# Altium schematic sheet 04_SoC_CFG_GPIOs.SchDoc
size A3; SheetNumber: 21; SheetTotal: 21
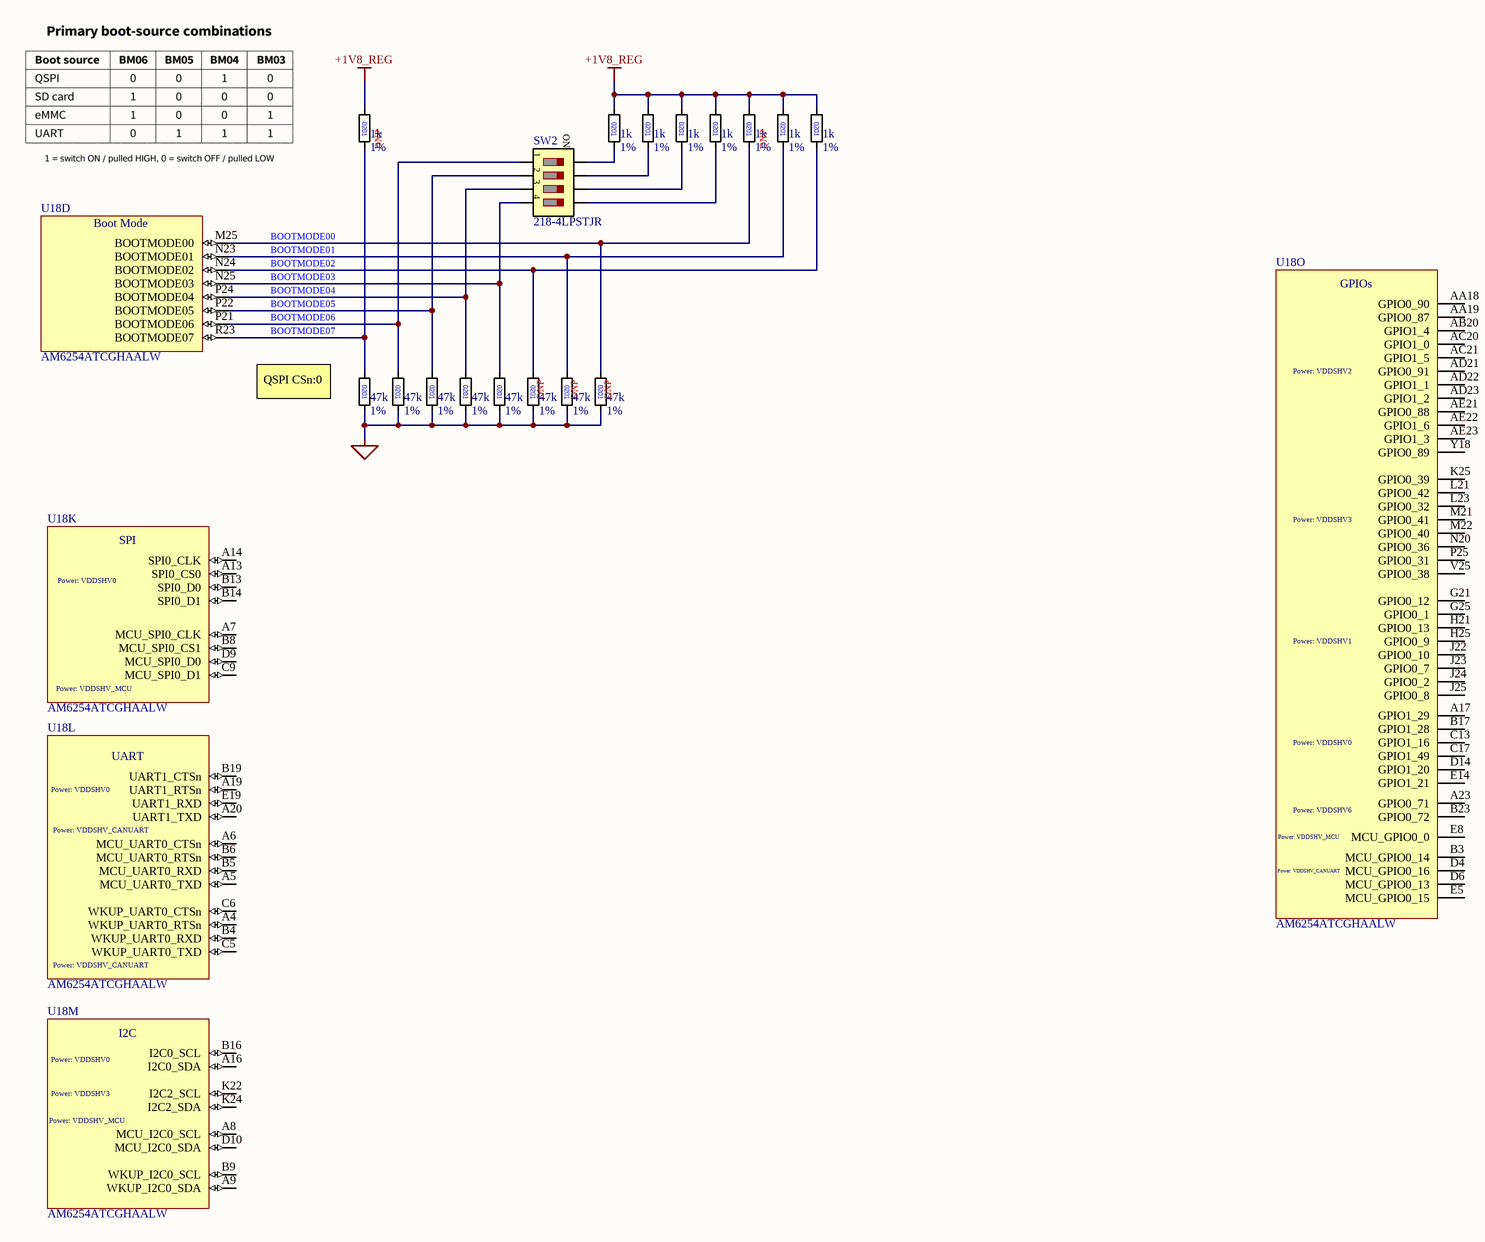
[diagram p0: 04_SoC_CFG_GPIOs.SchDoc]

## Parts
(Parts that share a designator on the sheet are numbered #1, #2 ... from top to bottom, then left to right.)
R196  value 1k  Tolerance: 1%  [R0201]  (hidden comment: 0201)
R197  value 1k  Tolerance: 1%  [R0201]  (hidden comment: 0201)
R198  value 1k  Tolerance: 1%  [R0201]  (hidden comment: 0201)
R199  value 1k  Tolerance: 1%  [R0201]  (hidden comment: 0201)
R200  value 1k  Tolerance: 1%  [R0201]  (hidden comment: 0201)
R201  value 1k  Tolerance: 1%  [R0201]  (hidden comment: 0201)
R202  value 1k  Tolerance: 1%  [R0201]  (hidden comment: 0201)
R203  value 1k  Tolerance: 1%  [R0201]  (hidden comment: 0201)
R204  value 47k  Tolerance: 1%  [R0201]  (hidden comment: 0201)
R205  value 47k  Tolerance: 1%  [R0201]  (hidden comment: 0201)
R206  value 47k  Tolerance: 1%  [R0201]  (hidden comment: 0201)
R207  value 47k  Tolerance: 1%  [R0201]  (hidden comment: 0201)
R208  value 47k  Tolerance: 1%  [R0201]  (hidden comment: 0201)
R209  value 47k  Tolerance: 1%  [R0201]  (hidden comment: 0201)
R210  value 47k  Tolerance: 1%  [R0201]  (hidden comment: 0201)
R211  value 47k  Tolerance: 1%  [R0201]  (hidden comment: 0201)
SW2  218-4LPSTJR  [SW_DIP_SPSTx04_Slide]
U18#1  AM6254ATCGHAALW  [AM6254ATCGHAALW]  (parts D,K,M,O of 15)
U18#2  AM6254ATCGHAALW  [AM6254ATCGHAALW]  (part L of 14)

## Nets
+1V8_REG: R196.1 R197.1 R198.1 R199.1 R200.1 R201.1 R202.1 R203.1
GND: R204.2 R205.2 R206.2 R207.2 R208.2 R209.2 R210.2 R211.2
BOOTMODE00: R201.2 R211.1 U18#1.M25(BOOTMODE00)
BOOTMODE01: R202.2 R210.1 U18#1.N23(BOOTMODE01)
BOOTMODE02: R203.2 R209.1 U18#1.N24(BOOTMODE02)
BOOTMODE03: R208.1 SW2.4 U18#1.N25(BOOTMODE03)
BOOTMODE04: R207.1 SW2.3 U18#1.P24(BOOTMODE04)
BOOTMODE05: R206.1 SW2.2 U18#1.P22(BOOTMODE05)
BOOTMODE06: R205.1 SW2.1 U18#1.P21(BOOTMODE06)
BOOTMODE07: R196.2 R204.1 U18#1.R23(BOOTMODE07)
NetR197_2: R197.2 SW2.8
NetR198_2: R198.2 SW2.7
NetR199_2: R199.2 SW2.6
NetR200_2: R200.2 SW2.5

Not connected (* = marked no-connect by the designer): U18#1 A7(MCU_SPI0_CLK) A8(MCU_I2C0_SCL) A9(WKUP_I2C0_SDA) A13(SPI0_CS0) A14(SPI0_CLK) A16(I2C0_SDA) A17(GPIO1_29) A23(GPIO0_71) AA18(GPIO0_90) AA19(GPIO0_87) AB20(GPIO1_4) AC20(GPIO1_0) AC21(GPIO1_5) AD21(GPIO0_91) AD22(GPIO1_1) AD23(GPIO1_2) AE21(GPIO0_88) AE22(GPIO1_6) AE23(GPIO1_3) B3(MCU_GPIO0_14) B8(MCU_SPI0_CS1) B9(WKUP_I2C0_SCL) B13(SPI0_D0) B14(SPI0_D1) B16(I2C0_SCL) B17(GPIO1_28) B23(GPIO0_72) C9(MCU_SPI0_D1) C13(GPIO1_16) C17(GPIO1_49) D4(MCU_GPIO0_16) D6(MCU_GPIO0_13) D9(MCU_SPI0_D0) D10(MCU_I2C0_SDA) D14(GPIO1_20) E5(MCU_GPIO0_15) E8(MCU_GPIO0_0) E14(GPIO1_21) G21(GPIO0_12) G25(GPIO0_1) H21(GPIO0_13) H25(GPIO0_9) J22(GPIO0_10) J23(GPIO0_7) J24(GPIO0_2) J25(GPIO0_8) K22(I2C2_SCL) K24(I2C2_SDA) K25(GPIO0_39) L21(GPIO0_42) L23(GPIO0_32) M21(GPIO0_41) M22(GPIO0_40) N20(GPIO0_36) P25(GPIO0_31) V25(GPIO0_38) Y18(GPIO0_89); U18#2 A4(WKUP_UART0_RTSn) A5(MCU_UART0_TXD) A6(MCU_UART0_CTSn) A19(UART1_RTSn) A20(UART1_TXD) B4(WKUP_UART0_RXD) B5(MCU_UART0_RXD) B6(MCU_UART0_RTSn) B19(UART1_CTSn) C5(WKUP_UART0_TXD) C6(WKUP_UART0_CTSn) E19(UART1_RXD)

## Notes on the sheet
- (near R196) DNP
- (near R201) DNP
- (near R204) QSPI CSn:0
- (near R209) DNP
- (near R210) DNP
- (near R211) DNP
- (in symbol AM6254ATCGHAALW, part D) Boot Mode
- (in symbol AM6254ATCGHAALW, part K) SPI; Power: VDDSHV0; Power: VDDSHV_MCU
- (in symbol AM6254ATCGHAALW, part L) UART; Power: VDDSHV0; Power: VDDSHV_CANUART
- (in symbol AM6254ATCGHAALW, part M) I2C; Power: VDDSHV0; Power: VDDSHV3; Power: VDDSHV_MCU
- (in symbol AM6254ATCGHAALW, part O) GPIOs; Power: VDDSHV2; Power: VDDSHV3; Power: VDDSHV1; Power: VDDSHV0; Power: VDDSHV6; Power: VDDSHV_MCU; Power: VDDSHV_CANUART
- (in symbol SW_DIP_4) ON

## Library data of the parts
R196-R211 = R_0201: Manufacturer_Name: *; Manufacturer_Part_Number: *
SW2 = SW_DIP_4: Manufacturer_Name: CTS Electrocomponents; Manufacturer_Part_Number: 218-4LPSTJR
U18#1 U18#2 = AM6254ATCGHAALW: TI AM6254, quad Cortex-A53 SoC, ALW 425-ball FCCSP 13x13mm 0.5mm pitch; separate interface and power units; Pinmux_Note: Each physical ball occurs once under its primary interface. See companion pinmux CSV for alternate functions. Multiplexable digital pads use bidirectional ERC type.; KiCad_Footprint: SamacSys_Parts:BGA425C50P25X25_1300X1300X89; MPN: AM6254ATCGHAALW; Footprint_Note: Unassigned: requires verified ALW0425 425-ball FCCSP, 13x13mm, 0.5mm pitch; do not substitute a fully populated BGA.; Datasheet: https://www.ti.com/lit/ds/symlink/am625.pdf; ComponentLink1Description: Datasheet; ComponentLink1URL: https://www.ti.com/lit/ds/symlink/am625.pdf